# Altium schematic sheet MainController4.SchDoc
size A4; SheetNumber: 5; SheetTotal: 5
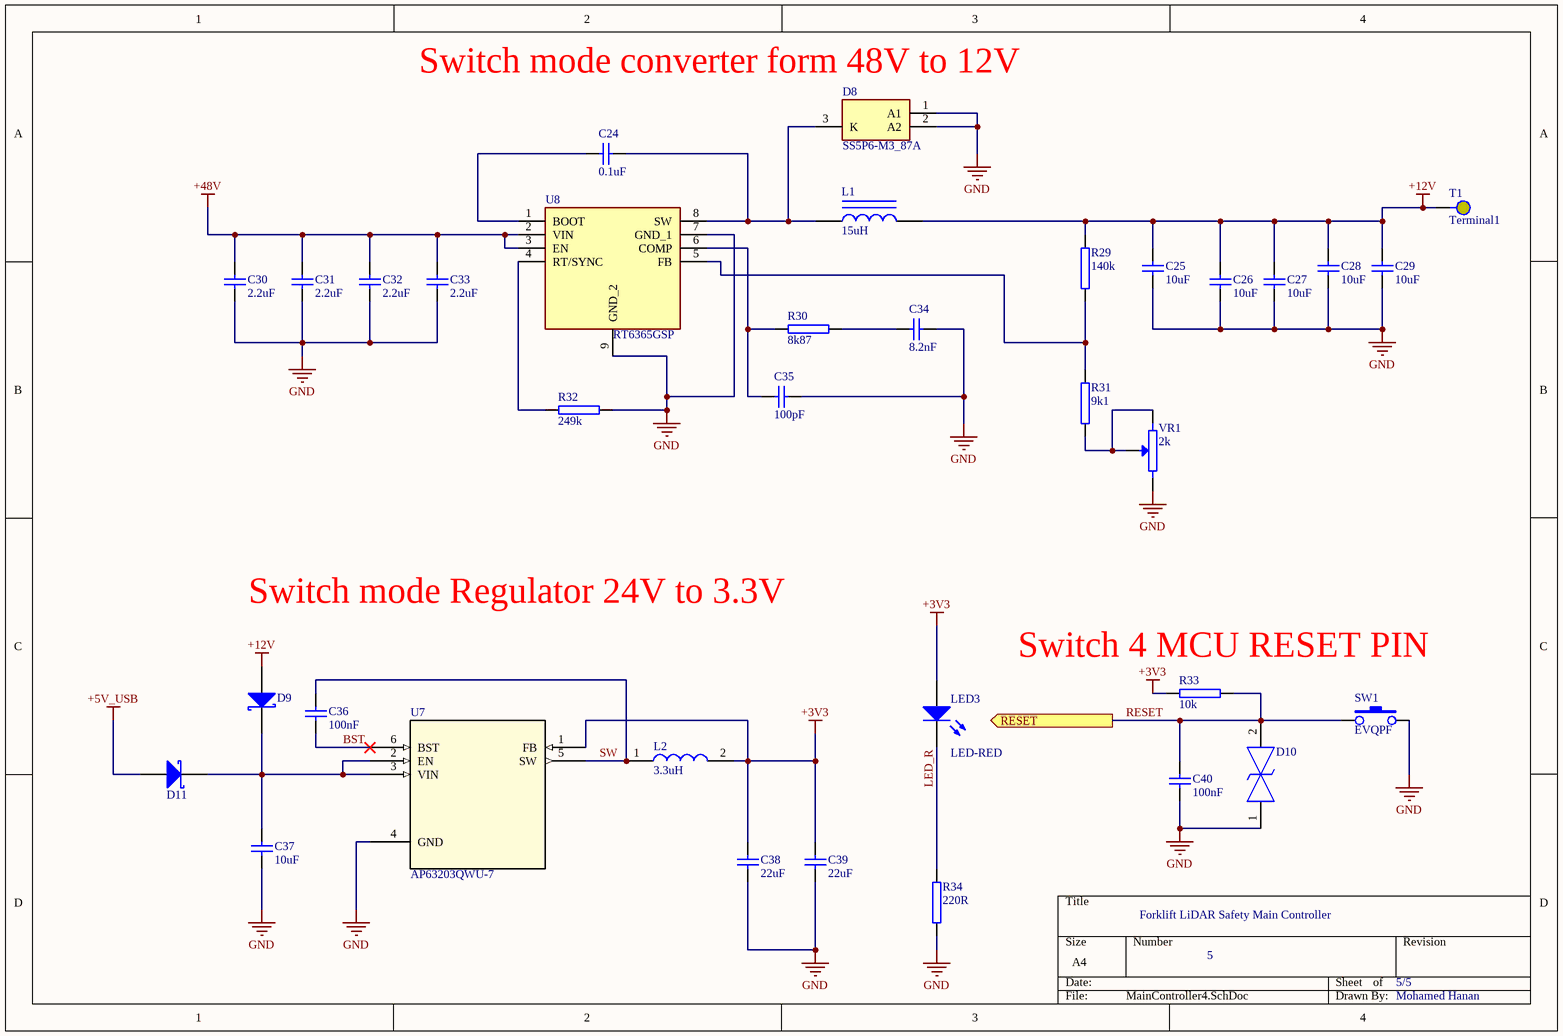
[diagram p0: MainController4.SchDoc]

## Parts
C24  0.1uF  [CAP_0805]
C25  10uF  [CAP_1206]
C26  10uF  [CAP_1206]
C27  10uF  [CAP_1206]
C28  10uF  [CAP_1206]
C29  10uF  [CAP_1206]
C30  2.2uF  [CAP_0805]
C31  2.2uF  [CAP_0805]
C32  2.2uF  [CAP_0805]
C33  2.2uF  [CAP_0805]
C34  8.2nF  [CAP_1206]
C35  100pF  [CAP_0805]
C36  100nF  [CAP_0805]
C37  10uF  [CAP_1206]
C38  22uF  [CAP_1206]
C39  22uF  [CAP_1206]
C40  100nF  [CAP_0805]
D8  SS5P6-M3_87A  [SS5P6M387A]
D9  PMEG3050BEP  [SOD-128]  (value not drawn)
D10  TSD05CDYFR  [SOD2613X100N]  (value not drawn)
D11  PMEG3050BEP  [SOD-128]  (value not drawn)
L1  15uH  [MSS1210]
L2  3.3uH  [SRP4020TA3R3M]
LED3  LED-RED  [LED1206R]
R29  140k  [RES_0805]
R30  8k87  [RES_0805]
R31  9k1  [RES_0805]
R32  249k  [RES_1206]
R33  10k  [RES_0805]
R34  220R  [RES_0805]
SW1  EVQPF  [EVQPF203M]
T1  Terminal1  [PAD1_AUT]
U7  AP63203QWU-7  [TSOT26_DIO]
U8  RT6365GSP  [SOIC127P600X175-9N]
VR1  2k  [3362S]

## Ports
RESET (out, see ConnectionMain[3C], MainController[2B])

## Nets
+3V3: C38.2 C39.2 L2.2 LED3.A R33.2 U7.1(FB)
+5V_USB: D11.A
+12V: C25.2 C26.2 C27.2 C28.2 C29.2 D9.A L1.2 R29.2 T1.1
+48V: C30.2 C31.2 C32.2 C33.2 U8.2(VIN) U8.3(EN)
GND: C25.1 C26.1 C27.1 C28.1 C29.1 C30.1 C31.1 C32.1 C33.1 C34.2 C35.2 C37.1 C38.1 C39.1 C40.1 D8.1(A1) D8.2(A2) D10.1 R32.2 R34.2 SW1.2 U7.4(GND) U8.7(GND_1) U8.9(GND_2) VR1.2(BOT)
BST: C36.1 U7.6(BST)
LED_R: LED3.K R34.1
RESET: C40.2 D10.2 R33.1 SW1.1 ; port RESET
SW: C36.2 L2.1 U7.5(SW)
NetC24_1: C24.1 U8.1(BOOT)
NetC24_2: C24.2 D8.3(K) L1.1 U8.8(SW)
NetC34_1: C34.1 R30.1
NetC35_1: C35.1 R30.2 U8.6(COMP)
NetC37_2: C37.2 D9.K D11.K U7.2(EN) U7.3(VIN)
NetR29_1: R29.1 R31.1 U8.5(FB)
NetR31_2: R31.2 VR1.1(TOP) VR1.W(TAP)
NetR32_1: R32.1 U8.4(RT/SYNC)

## Notes on the sheet
- (near D8) Switch mode converter form 48V to 12V
- Switch mode Regulator 24V to 3.3V
- (near R33) Switch 4 MCU RESET PIN
- Forklift LiDAR Safety Main Controller
- 5
- 5/5
- Mohamed Hanan

## Library data of the parts
C24 C30-C33 C35 C36 C40 = CAPN 0805: Non Polarized Capacitor, SMD, 0805
C25-C29 C34 C37-C39 = CAPN 1206: Non Polarized Capacitor, SMD, 1206
D8 = SS5P6-M3_87A: Schottky Diode; Manufacturer_Name: Vishay; Manufacturer_Part_Number: SS5P6-M3/87A; Datasheet Link: https://www.vishay.com/docs/88988/ss5p6.pdf; Height: 1.2mm; Mouser Part Number: 625-SS5P6-M3/87A; Mouser Price/Stock: https://www.mouser.co.uk/ProductDetail/Vishay-General-Semiconductor/SS5P6-M3-87A?qs=XGzIaZb%2FFYLx0h%2FWoI%2FVUQ%3D%3D; Arrow Part Number: SS5P6-M3/87A; Arrow Price/Stock: https://www.arrow.com/en/products/ss5p6-m387a/vishay?utm_currency=USD&region=nac
D9 D11 = PMEG3050BEP: Schottky REC, 30V, 5A, SMD; Supplier 1: Farnell; Supplier Part Number 1: 1829196
D10 = TSD05CDYFR: TVS Diode (Bi-directional); Manufacturer_Name: Texas Instruments; Datasheet Link: https://www.ti.com/lit/ds/symlink/tsd05c.pdf?ts=1691730725852&ref_url=https%253A%252F%252Fwww.ti.com%252Fproduct%252FTSD05C%253FkeyMatch%253DTSD05CDYFR%2526tisearch%253Dsearch-everything%2526usecase%253DOPN; Height: 1mm; Manufacturer_Part_Number: TSD05CDYFR; Mouser Part Number: 595-TSD05CDYFR; Mouser Price/Stock: https://www.mouser.co.uk/ProductDetail/Texas-Instruments/TSD05CDYFR?qs=Imq1NPwxi74wAiGFX0POZQ%3D%3D; Arrow Part Number: TSD05CDYFR; Arrow Price/Stock: https://www.arrow.com/en/products/tsd05cdyfr/texas-instruments.html?utm_currency=USD&region=nac
L1 = MSS1210-153MED: Inductor, 15uH, 8.7A , AEC-Q200 MSS1210 Series; Supplier 1: Farnell; Supplier Part Number 1: 2288331
L2 = SRP4020TA-3R3M: Inductor; Manufacturer_Name: Bourns; Datasheet Link: https://www.bourns.com/docs/Product-Datasheets/SRP4020TA.pdf; Height: 2mm; Manufacturer_Part_Number: SRP4020TA-3R3M; Mouser Part Number: 652-SRP4020TA-3R3M; Mouser Price/Stock: https://www.mouser.co.uk/ProductDetail/Bourns/SRP4020TA-3R3M?qs=Ph8%2FHnX6CQx4K7XcRwo6CA%3D%3D; Arrow Part Number: SRP4020TA-3R3M; Arrow Price/Stock: https://www.arrow.com/en/products/srp4020ta-3r3m/bourns?region=nac
LED3 = SMD 1206 LED-RED: RED LED, Case 1206; Supplier 1: Farnell; Supplier Part Number 1: 8530017
R29-R31 R33 R34 = Resistor 0805: Resistor, SMD, 0805
R32 = Resistor 1206: Resistor, SMD, 1206
SW1 = EVQPF: PANASONIC  EVQPF203M  SWITCH, TACTILE, SPST-NO, 20mA, 15VDC; Supplier 1: Farnell; Supplier Part Number 1: 2079505
T1 = Terminal1: Terminal, Pad 70x70mil, Hole 32 mil
U7 = AP63203QWU-7: Description; Manufacturer_Name: Diodes Inc; Type: Power Management; Copyright: Copyright (C) 2026 Ultra Librarian. All rights reserved.; Manufacturer_Part_Number: AP63203QWU-7; RefDes: RefDes
U8 = RT6365GSP: Integrated Circuit; Manufacturer_Name: RICHTEK; Datasheet Link: https://www.richtek.com/assets/product_file/RT6365/DS6365-02.pdf; Height: 1.753mm; Manufacturer_Part_Number: RT6365GSP; Mouser Part Number: 835-RT6365GSP; Mouser Price/Stock: https://www.mouser.co.uk/ProductDetail/Richtek/RT6365GSP?qs=amGC7iS6iy%252BGHkAL3RFUug%3D%3D
VR1 = 3362S-1-202LF: 3362S Series, 1/4 ” Square  Potentiometer, 2k, 10%, 0.5 Watts, 1Turn; Supplier 1: Farnell; Supplier Part Number 1: 2321842